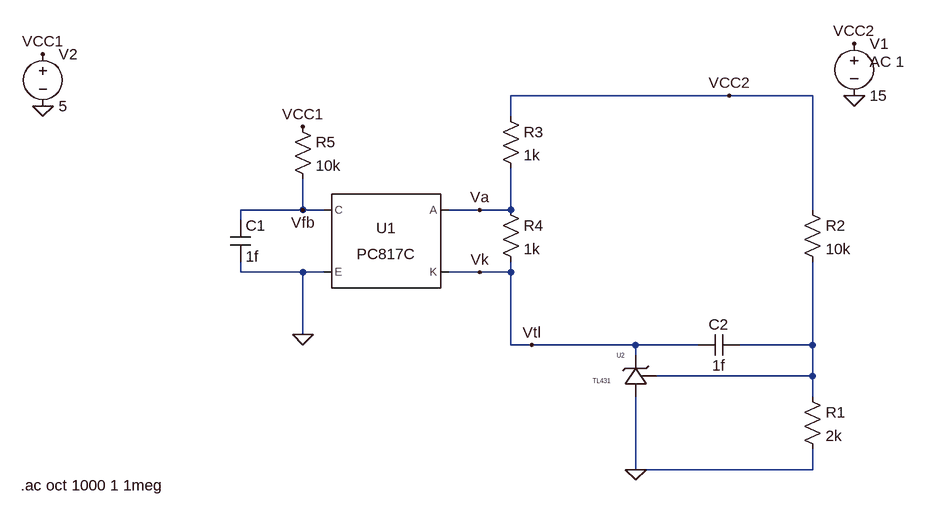
[diagram p0: schematic tl431_opto_feedback.asc]
tl431_opto_feedback.asc, the LTspice schematic file:
Version 4
SHEET 1 1120 680
WIRE 848 -128 512 -128
WIRE 976 -128 848 -128
WIRE 512 -96 512 -128
WIRE 192 48 192 0
WIRE 192 48 96 48
WIRE 224 48 192 48
WIRE 464 48 416 48
WIRE 512 48 512 -16
WIRE 512 48 464 48
WIRE 976 48 976 -128
WIRE 96 64 96 48
WIRE 96 144 96 128
WIRE 192 144 96 144
WIRE 224 144 192 144
WIRE 464 144 416 144
WIRE 512 144 512 128
WIRE 512 144 464 144
WIRE 192 240 192 144
WIRE 512 256 512 144
WIRE 544 256 512 256
WIRE 704 256 544 256
WIRE 800 256 704 256
WIRE 976 256 976 128
WIRE 976 256 864 256
WIRE 704 272 704 256
WIRE 976 304 976 256
WIRE 976 304 736 304
WIRE 976 336 976 304
WIRE 704 448 704 336
WIRE 976 448 976 416
WIRE 976 448 704 448
FLAG -208 -112 0
FLAG 192 240 0
FLAG 704 448 0
FLAG 1040 -128 0
FLAG -208 -192 VCC1
FLAG 192 -80 VCC1
FLAG 848 -128 VCC2
FLAG 1040 -208 VCC2
FLAG 192 48 Vfb
FLAG 464 48 Va
FLAG 464 144 Vk
FLAG 544 256 Vtl
SYMBOL Optos\\PC817C 320 96 M0
SYMATTR InstName U1
SYMBOL TL431 720 272 M0
SYMATTR InstName U2
SYMBOL voltage 1040 -224 R0
WINDOW 123 24 44 Left 2
WINDOW 39 0 0 Left 0
SYMATTR InstName V1
SYMATTR Value 15
SYMATTR Value2 AC 1
SYMBOL res 960 320 R0
SYMATTR InstName R1
SYMATTR Value 2k
SYMBOL res 960 32 R0
SYMATTR InstName R2
SYMATTR Value 10k
SYMBOL res 496 -112 R0
SYMATTR InstName R3
SYMATTR Value 1k
SYMBOL res 496 32 R0
SYMATTR InstName R4
SYMATTR Value 1k
SYMBOL res 176 -96 R0
SYMATTR InstName R5
SYMATTR Value 10k
SYMBOL voltage -208 -208 R0
WINDOW 123 0 0 Left 0
WINDOW 39 0 0 Left 0
SYMATTR InstName V2
SYMATTR Value 5
SYMBOL cap 80 64 R0
SYMATTR InstName C1
SYMATTR Value 1f
SYMBOL cap 864 240 R90
WINDOW 0 0 32 VBottom 2
WINDOW 3 32 32 VTop 2
SYMATTR InstName C2
SYMATTR Value 1f
TEXT -242 472 Left 2 !.ac oct 1000 1 1meg

The netlist it stands for:
* tl431_opto_feedback.asc
XU1 Va Vtl Vfb 0 PC817 Igain=2.3m  ; PC817C, pins A K C E
XU2 0 Vtl N001 TL431  ; pins A K R
V1 VCC2 0 15 AC 1
R1 N001 0 2k
R2 VCC2 N001 10k
R3 VCC2 Va 1k
R4 Va Vtl 1k
R5 VCC1 Vfb 10k
V2 VCC1 0 5
C1 Vfb 0 1f
C2 N001 Vtl 1f
.ac oct 1000 1 1meg
.lib PC817.sub
.lib TL431.lib
.backanno
.end